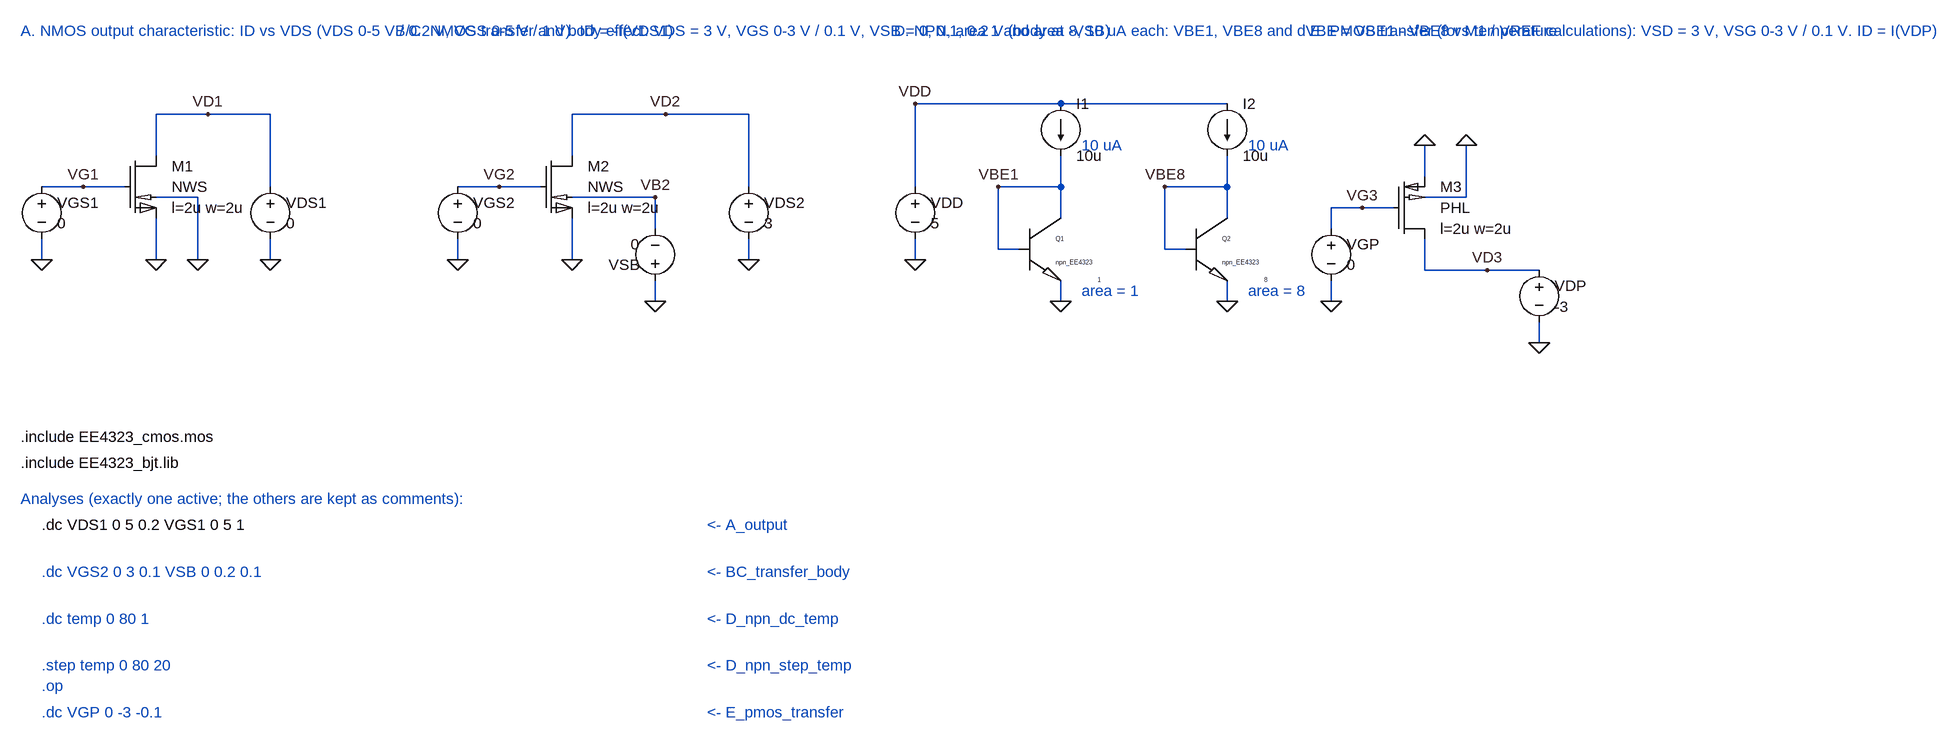
[diagram p0: schematic 01_Characterisation.asc]
01_Characterisation.asc, the LTspice schematic file:
Version 4
SHEET 1 2700 1100
WIRE 96 256 96 288
WIRE 96 176 224 176
WIRE 272 224 272 288
WIRE 272 192 336 192
WIRE 336 192 336 288
WIRE 448 256 448 288
WIRE 272 128 272 64
WIRE 272 64 448 64
WIRE 448 64 448 176
WIRE 736 256 736 288
WIRE 736 176 864 176
WIRE 912 224 912 288
WIRE 912 192 1040 192
WIRE 1040 192 1040 240
WIRE 1040 320 1040 352
WIRE 1184 256 1184 288
WIRE 912 128 912 64
WIRE 912 64 1184 64
WIRE 1184 64 1184 176
WIRE 1440 256 1440 288
WIRE 1440 176 1440 48
WIRE 1440 48 1664 48
WIRE 1664 48 1920 48
WIRE 1664 128 1664 224
WIRE 1600 272 1568 272
WIRE 1568 272 1568 176
WIRE 1568 176 1664 176
WIRE 1664 320 1664 352
WIRE 1920 128 1920 224
WIRE 1856 272 1824 272
WIRE 1824 272 1824 176
WIRE 1824 176 1920 176
WIRE 1920 320 1920 352
WIRE 2224 160 2224 112
WIRE 2224 192 2288 192
WIRE 2288 192 2288 112
WIRE 2080 240 2080 208
WIRE 2080 208 2176 208
WIRE 2080 320 2080 352
WIRE 2224 256 2224 304
WIRE 2224 304 2400 304
WIRE 2400 384 2400 416
FLAG 96 288 0
FLAG 160 176 VG1
FLAG 272 288 0
FLAG 336 288 0
FLAG 448 288 0
FLAG 352 64 VD1
FLAG 736 288 0
FLAG 800 176 VG2
FLAG 912 288 0
FLAG 1040 192 VB2
FLAG 1040 352 0
FLAG 1184 288 0
FLAG 1056 64 VD2
FLAG 1440 288 0
FLAG 1440 48 VDD
FLAG 1568 176 VBE1
FLAG 1664 352 0
FLAG 1824 176 VBE8
FLAG 1920 352 0
FLAG 2224 112 0
FLAG 2288 112 0
FLAG 2128 208 VG3
FLAG 2080 352 0
FLAG 2320 304 VD3
FLAG 2400 416 0
SYMBOL voltage 96 160 R0
WINDOW 0 24 40 Left 2
WINDOW 3 24 72 Left 2
SYMATTR InstName VGS1
SYMATTR Value 0
SYMBOL nmos_NWS 224 128 R0
WINDOW 0 72 16 Left 2
WINDOW 3 72 48 Left 2
WINDOW 123 72 80 Left 2
SYMATTR InstName M1
SYMATTR Value NWS
SYMATTR Value2 l=2u w=2u
SYMBOL voltage 448 160 R0
WINDOW 0 24 40 Left 2
WINDOW 3 24 72 Left 2
SYMATTR InstName VDS1
SYMATTR Value 0
SYMBOL voltage 736 160 R0
WINDOW 0 24 40 Left 2
WINDOW 3 24 72 Left 2
SYMATTR InstName VGS2
SYMATTR Value 0
SYMBOL nmos_NWS 864 128 R0
WINDOW 0 72 16 Left 2
WINDOW 3 72 48 Left 2
WINDOW 123 72 80 Left 2
SYMATTR InstName M2
SYMATTR Value NWS
SYMATTR Value2 l=2u w=2u
SYMBOL voltage 1040 336 R180
WINDOW 0 24 40 Left 2
WINDOW 3 24 72 Left 2
SYMATTR InstName VSB
SYMATTR Value 0
SYMBOL voltage 1184 160 R0
WINDOW 0 24 40 Left 2
WINDOW 3 24 72 Left 2
SYMATTR InstName VDS2
SYMATTR Value 3
SYMBOL voltage 1440 160 R0
WINDOW 0 24 40 Left 2
WINDOW 3 24 72 Left 2
SYMATTR InstName VDD
SYMATTR Value 5
SYMBOL current 1664 48 R0
SYMATTR InstName I1
SYMATTR Value 10u
SYMBOL npn_npn 1600 224 R0
SYMATTR InstName Q1
SYMATTR Value npn_EE4323
SYMATTR Value2 1
SYMBOL current 1920 48 R0
SYMATTR InstName I2
SYMATTR Value 10u
SYMBOL npn_npn 1856 224 R0
SYMATTR InstName Q2
SYMATTR Value npn_EE4323
SYMATTR Value2 8
SYMBOL pmos_PHL 2176 160 R0
WINDOW 0 72 16 Left 2
WINDOW 3 72 48 Left 2
WINDOW 123 72 80 Left 2
SYMATTR InstName M3
SYMATTR Value PHL
SYMATTR Value2 l=2u w=2u
SYMBOL voltage 2080 224 R0
WINDOW 0 24 40 Left 2
WINDOW 3 24 72 Left 2
SYMATTR InstName VGP
SYMATTR Value 0
SYMBOL voltage 2400 288 R0
WINDOW 0 24 40 Left 2
WINDOW 3 24 72 Left 2
SYMATTR InstName VDP
SYMATTR Value -3
TEXT 64 -64 Left 2 ;A. NMOS output characteristic: ID vs VDS (VDS 0-5 V / 0.2 V, VGS 0-5 V / 1 V). ID = -I(VDS1)
TEXT 640 -64 Left 2 ;B/C. NMOS transfer and body effect: VDS = 3 V, VGS 0-3 V / 0.1 V, VSB = 0, 0.1, 0.2 V (body at -VSB)
TEXT 1408 -64 Left 2 ;D. NPN, area 1 and area 8, 10 uA each: VBE1, VBE8 and dVBE = VBE1 - VBE8 vs temperature
TEXT 1696 112 Left 2 ;10 uA
TEXT 1696 336 Left 2 ;area = 1
TEXT 1952 112 Left 2 ;10 uA
TEXT 1952 336 Left 2 ;area = 8
TEXT 2048 -64 Left 2 ;E. PMOS transfer (for M1 / VREF calculations): VSD = 3 V, VSG 0-3 V / 0.1 V. ID = I(VDP)
TEXT 64 560 Left 2 !.include EE4323_cmos.mos
TEXT 64 600 Left 2 !.include EE4323_bjt.lib
TEXT 64 656 Left 2 ;Analyses (exactly one active; the others are kept as comments):
TEXT 96 696 Left 2 !.dc VDS1 0 5 0.2 VGS1 0 5 1
TEXT 1120 696 Left 2 ;<- A_output
TEXT 96 768 Left 2 ;.dc VGS2 0 3 0.1 VSB 0 0.2 0.1
TEXT 1120 768 Left 2 ;<- BC_transfer_body
TEXT 96 840 Left 2 ;.dc temp 0 80 1
TEXT 1120 840 Left 2 ;<- D_npn_dc_temp
TEXT 96 912 Left 2 ;.step temp 0 80 20\n.op
TEXT 1120 912 Left 2 ;<- D_npn_step_temp
TEXT 96 984 Left 2 ;.dc VGP 0 -3 -0.1
TEXT 1120 984 Left 2 ;<- E_pmos_transfer

The netlist it stands for:
* 01_Characterisation.asc
VGS1 VG1 0 0
M1 VD1 VG1 0 0 NWS l=2u w=2u
VDS1 VD1 0 0
VGS2 VG2 0 0
M2 VD2 VG2 0 VB2 NWS l=2u w=2u
VSB 0 VB2 0
VDS2 VD2 0 3
VDD VDD 0 5
I1 VDD VBE1 10u
Q1 VBE1 VBE1 0 0 npn_EE4323 1
I2 VDD VBE8 10u
Q2 VBE8 VBE8 0 0 npn_EE4323 8
M3 VD3 VG3 0 0 PHL l=2u w=2u
VGP VG3 0 0
VDP VD3 0 -3
.model NPN NPN
.model PNP PNP
.lib standard.bjt
.model NMOS NMOS
.model PMOS PMOS
.lib standard.mos
* A. NMOS output characteristic: ID vs VDS (VDS 0-5 V / 0.2 V, VGS 0-5 V / 1 V). ID = -I(VDS1)
* B/C. NMOS transfer and body effect: VDS = 3 V, VGS 0-3 V / 0.1 V, VSB = 0, 0.1, 0.2 V (body at -VSB)
* D. NPN, area 1 and area 8, 10 uA each: VBE1, VBE8 and dVBE = VBE1 - VBE8 vs temperature
* 10 uA
* area = 1
* 10 uA
* area = 8
* E. PMOS transfer (for M1 / VREF calculations): VSD = 3 V, VSG 0-3 V / 0.1 V. ID = I(VDP)
.include EE4323_cmos.mos
.include EE4323_bjt.lib
* Analyses (exactly one active; the others are kept as comments):
.dc VDS1 0 5 0.2 VGS1 0 5 1
* <- A_output
* .dc VGS2 0 3 0.1 VSB 0 0.2 0.1
* <- BC_transfer_body
* .dc temp 0 80 1
* <- D_npn_dc_temp
* .step temp 0 80 20
* .op
* <- D_npn_step_temp
* .dc VGP 0 -3 -0.1
* <- E_pmos_transfer
.backanno
.end